# Altium schematic sheet IMU.SchDoc
size A; DocumentNumber: 9; SheetNumber: 9; SheetTotal: 14
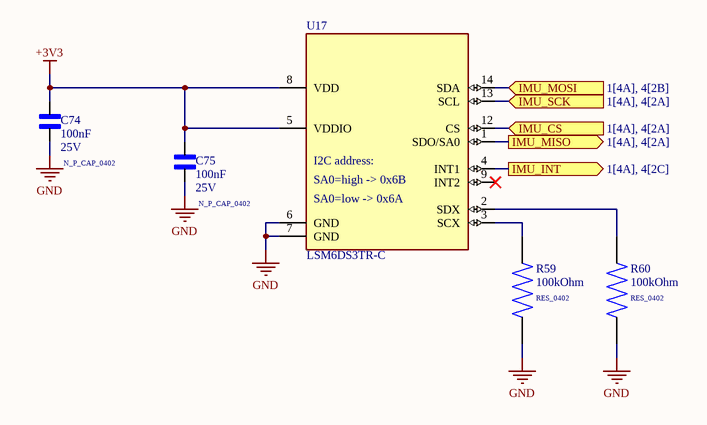
[diagram p0: IMU.SchDoc]

## Parts
C74  N_P_CAP_0402  value 100nF  Rated Voltage: 25V  [N_P_CAP_0402]
C75  N_P_CAP_0402  value 100nF  Rated Voltage: 25V  [N_P_CAP_0402]
R59  RES_0402  value 100kOhm  [RES_0402]
R60  RES_0402  value 100kOhm  [RES_0402]
U17  LSM6DS3TR-C  [LGA-14-2.5X3MM]

## Ports
IMU_CS (in, see 1[4A], 4[2A]), IMU_INT (out, see 1[4A], 4[2C]), IMU_MISO (out, see 1[4A], 4[2A]), IMU_MOSI (in, see 1[4A], 4[2B]), IMU_SCK (in, see 1[4A], 4[2A])

## Nets
+3V3: C74.2 C75.2 U17.5(VDDIO) U17.8(VDD)
GND: C74.1 C75.1 R59.2 R60.2 U17.6(GND) U17.7(GND)
IMU_CS: U17.12(CS) ; port IMU_CS
IMU_INT: U17.4(INT1) ; port IMU_INT
IMU_MISO: U17.1(SDO/SA0) ; port IMU_MISO
IMU_MOSI: U17.14(SDA) ; port IMU_MOSI
IMU_SCK: U17.13(SCL) ; port IMU_SCK
NetR59_1: R59.1 U17.3(SCX)
NetR60_1: R60.1 U17.2(SDX)

Not connected (* = marked no-connect by the designer): U17 9(INT2)*

## Notes on the sheet
- (in symbol LSM6DS3TR-C) I2C address:; SA0=high -> 0x6B; SA0=low -> 0x6A

## Library data of the parts
C74 C75 = N_P_CAP: GENERIC NON-POLARIZED CAP; Temperature Coefficient: X7R; LCSC Part Number: C105883; Tolerance: *; MF: *; ESR: *; MPN: *
R59 R60 = RES: GENERIC RES; Tolerance: 1%; Power Rating: *; MPN: *; Rated Voltage: *; Temperature Coefficient: *; LCSC Part Number: C60491
U17 = LSM6DS3TR-C: IMUs - Inertial Measurement Units iNEMO 6DoF inertial module, for entry level / mid-tier smart phones and Portable PC platforms; MF: STMicroelectronics; MPN: LSM6DS3TR-C; LCSC Part Number: C967633